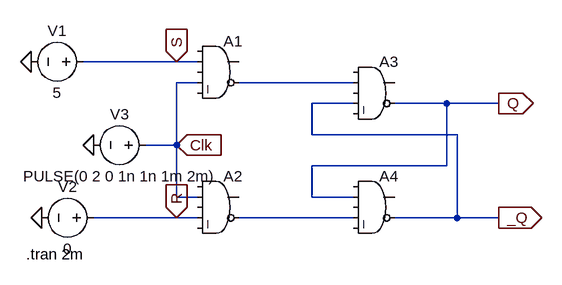
[diagram p0: schematic rsff.asc]
rsff.asc, the LTspice schematic file:
Version 4.1
SHEET 1 880 680
WIRE 64 80 -80 80
WIRE 96 80 64 80
WIRE 96 112 64 112
WIRE 336 112 160 112
WIRE 336 144 272 144
WIRE 480 144 400 144
WIRE 560 144 480 144
WIRE 272 192 272 144
WIRE 496 192 272 192
WIRE 64 208 64 112
WIRE 64 208 16 208
WIRE 480 240 480 144
WIRE 480 240 272 240
WIRE 64 288 64 208
WIRE 96 288 64 288
WIRE 272 288 272 240
WIRE 336 288 272 288
WIRE 64 320 -64 320
WIRE 96 320 64 320
WIRE 336 320 160 320
WIRE 496 320 496 192
WIRE 496 320 400 320
WIRE 560 320 496 320
FLAG -160 80 0
FLAG -64 208 0
FLAG -144 320 0
FLAG 64 80 S
IOPIN 64 80 In
FLAG 64 320 R
IOPIN 64 320 In
FLAG 64 208 Clk
IOPIN 64 208 In
FLAG 560 144 Q
IOPIN 560 144 Out
FLAG 560 320 _Q
IOPIN 560 320 Out
SYMBOL Digital\\and 128 32 R0
SYMATTR InstName A1
SYMBOL Digital\\and 128 240 R0
SYMATTR InstName A2
SYMBOL Digital\\and 368 64 R0
SYMATTR InstName A3
SYMBOL Digital\\and 368 240 R0
SYMATTR InstName A4
SYMBOL voltage -64 80 R90
WINDOW 0 -32 56 VBottom 2
WINDOW 3 32 56 VTop 2
WINDOW 123 0 0 Left 0
WINDOW 39 0 0 Left 0
SYMATTR InstName V1
SYMATTR Value 5
SYMBOL voltage -48 320 R90
WINDOW 0 -32 56 VBottom 2
WINDOW 3 32 56 VTop 2
WINDOW 123 0 0 Left 0
WINDOW 39 0 0 Left 0
SYMATTR InstName V2
SYMATTR Value 0
SYMBOL voltage 32 208 R90
WINDOW 0 -32 56 VBottom 2
WINDOW 3 32 56 VTop 2
WINDOW 123 0 0 Left 0
WINDOW 39 0 0 Left 0
SYMATTR InstName V3
SYMATTR Value PULSE(0 2 0 1n 1n 1m 2m)
TEXT -168 376 Left 2 !.tran 2m

The netlist it stands for:
* rsff.asc
A1 0 S 0 Clk 0 N001 0 0 AND
A2 0 Clk 0 R 0 N002 0 0 AND
A3 0 N001 0 _Q 0 Q 0 0 AND
A4 0 Q 0 N002 0 _Q 0 0 AND
V1 S 0 5
V2 R 0 0
V3 Clk 0 PULSE(0 2 0 1n 1n 1m 2m)
.tran 2m
.backanno
.end